# Altium schematic sheet Top_Sheet.SchDoc
size A4; DocumentNumber: 1; SheetNumber: 1; SheetTotal: 17
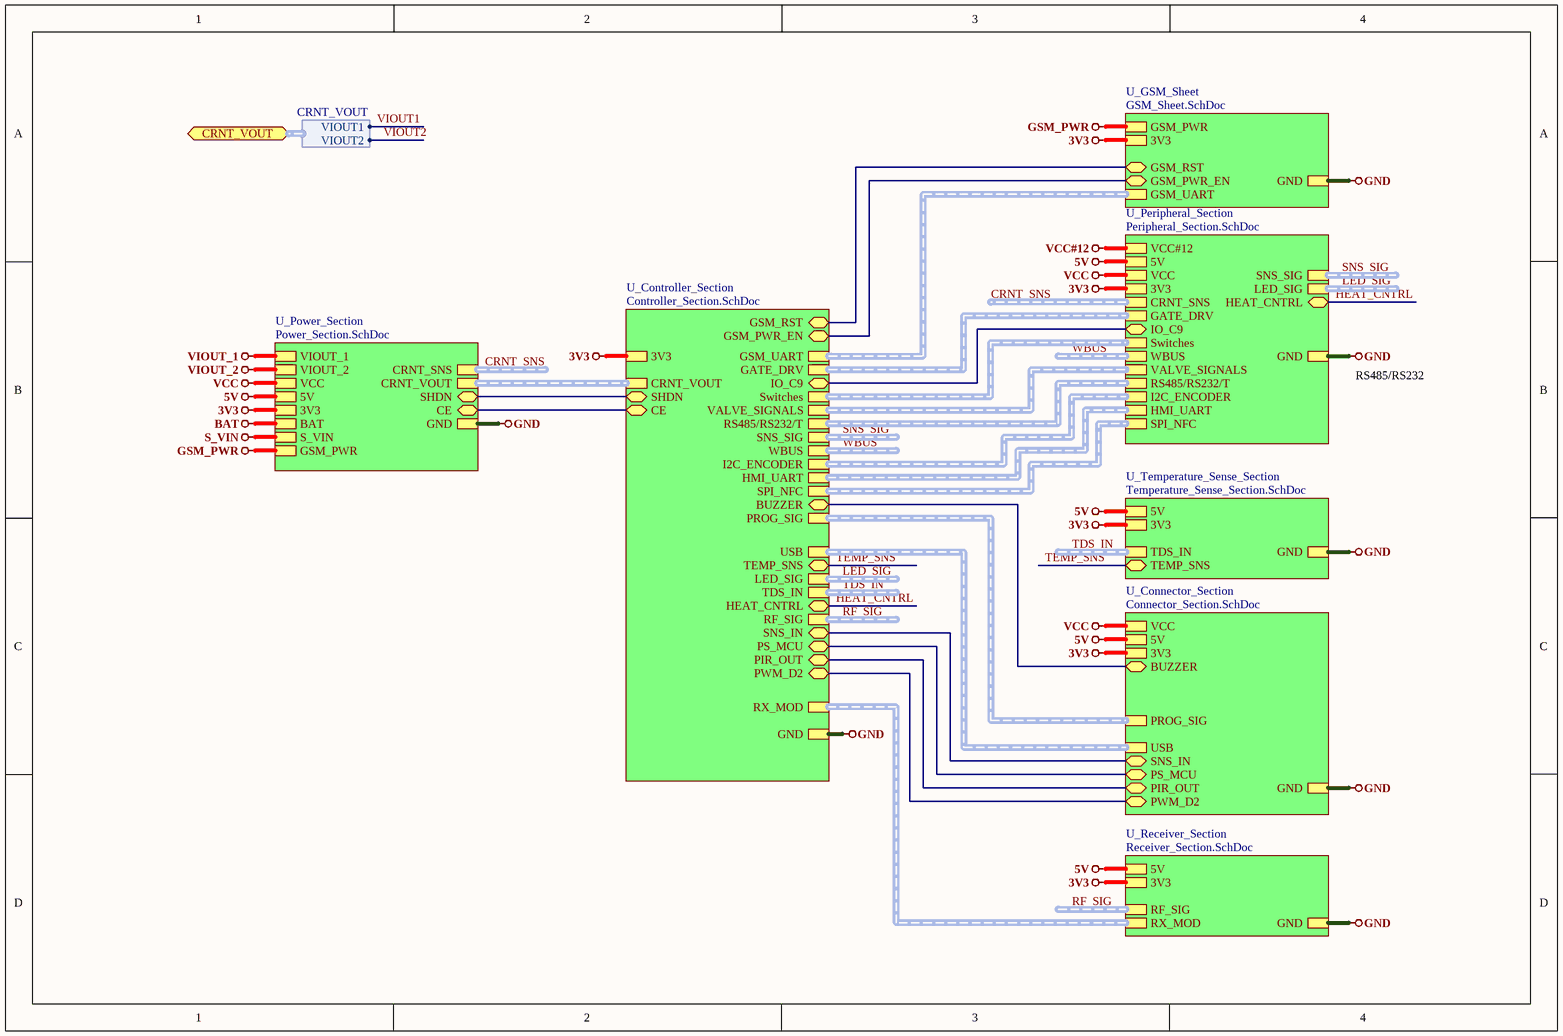
[diagram p0: Top_Sheet.SchDoc]

## Sub-sheets
U_Connector_Section = Connector_Section.SchDoc: PROG_SIG (harness PROG_SIG), BUZZER (bidir), VCC, 5V, 3V3, GND, PS_MCU (bidir), SNS_IN (bidir), PIR_OUT (bidir), USB (harness USB), PWM_D2 (bidir)
U_Controller_Section = Controller_Section.SchDoc: PROG_SIG (harness PROG_SIG), BUZZER (bidir), GATE_DRV (harness GATE_DRV), IO_C9 (bidir), GND, 3V3, SHDN (bidir), Switches (harness Switches), LED_SIG (harness LED_SIG), HEAT_CNTRL (bidir), VALVE_SIGNALS (harness VALVE_SIGNALS), SNS_SIG (harness SNS_SIG), WBUS (harness WBUS), PS_MCU (bidir), SNS_IN (bidir), RF_SIG (harness RF_SIG), PIR_OUT (bidir), RX_MOD (harness RX_MOD), CRNT_VOUT (harness CRNT_VOUT), TDS_IN (harness TDS_IN), USB (harness USB), PWM_D2 (bidir), CE (bidir), I2C_ENCODER (harness VALVE_SIGNALS), HMI_UART (harness VALVE_SIGNALS), GSM_UART (harness GSM_UART), GSM_PWR_EN (bidir), GSM_RST (bidir), TEMP_SNS (bidir), SPI_NFC (harness VALVE_SIGNALS), RS485/RS232/T (harness RS485/RS232/T)
U_GSM_Sheet = GSM_Sheet.SchDoc: GSM_UART (harness GSM_UART), GND, GSM_PWR, 3V3, GSM_RST (bidir), GSM_PWR_EN (bidir)
U_Peripheral_Section = Peripheral_Section.SchDoc: VCC, GND, 3V3, GATE_DRV (harness GATE_DRV), IO_C9 (bidir), Switches (harness Switches), CRNT_SNS (harness CRNT_SNS), VALVE_SIGNALS (harness VALVE_SIGNALS), SNS_SIG (harness SNS_SIG), LED_SIG (harness LED_SIG), 5V, HEAT_CNTRL (bidir), WBUS (harness WBUS), I2C_ENCODER (harness VALVE_SIGNALS), HMI_UART (harness VALVE_SIGNALS), VCC#12, SPI_NFC (harness VALVE_SIGNALS), RS485/RS232/T (harness RS485/RS232/T)
U_Power_Section = Power_Section.SchDoc: VIOUT_1, VIOUT_2, VCC, 5V, 3V3, GND, CRNT_SNS (harness CRNT_SNS), SHDN (bidir), CRNT_VOUT (harness CRNT_VOUT), BAT, S_VIN, CE (bidir), GSM_PWR
U_Receiver_Section = Receiver_Section.SchDoc: RF_SIG (harness RF_SIG), 5V, GND, RX_MOD (harness RX_MOD), 3V3
U_Temperature_Sense_Section = Temperature_Sense_Section.SchDoc: 5V, GND, 3V3, TDS_IN (harness TDS_IN), TEMP_SNS (bidir)

## Ports
CRNT_VOUT (bidir, harness CRNT_VOUT)

## Harnesses
CRNT_VOUT: VIOUT1, VIOUT2

## Nets
3V3: sheet U_Power_Section/3V3, sheet U_Connector_Section/3V3, sheet U_Temperature_Sense_Section/3V3, sheet U_Receiver_Section/3V3, sheet U_Controller_Section/3V3, sheet U_Peripheral_Section/3V3, sheet U_GSM_Sheet/3V3
5V: sheet U_Power_Section/5V, sheet U_Connector_Section/5V, sheet U_Temperature_Sense_Section/5V, sheet U_Receiver_Section/5V, sheet U_Peripheral_Section/5V
BAT: sheet U_Power_Section/BAT
GND: sheet U_Power_Section/GND, sheet U_Connector_Section/GND, sheet U_Temperature_Sense_Section/GND, sheet U_Receiver_Section/GND, sheet U_Controller_Section/GND, sheet U_Peripheral_Section/GND, sheet U_GSM_Sheet/GND
GSM_PWR: sheet U_Power_Section/GSM_PWR, sheet U_GSM_Sheet/GSM_PWR
S_VIN: sheet U_Power_Section/S_VIN
VCC: sheet U_Power_Section/VCC, sheet U_Connector_Section/VCC, sheet U_Peripheral_Section/VCC
VCC#12: sheet U_Peripheral_Section/VCC#12
VIOUT_1: sheet U_Power_Section/VIOUT_1
VIOUT_2: sheet U_Power_Section/VIOUT_2
HEAT_CNTRL: sheet U_Controller_Section/HEAT_CNTRL, sheet U_Peripheral_Section/HEAT_CNTRL
TEMP_SNS: sheet U_Temperature_Sense_Section/TEMP_SNS, sheet U_Controller_Section/TEMP_SNS
VIOUT1: port CRNT_VOUT.VIOUT1
VIOUT2: port CRNT_VOUT.VIOUT2
(unnamed): sheet U_Power_Section/SHDN, sheet U_Controller_Section/SHDN
(unnamed): sheet U_Power_Section/CE, sheet U_Controller_Section/CE
(unnamed): sheet U_Connector_Section/BUZZER, sheet U_Controller_Section/BUZZER
(unnamed): sheet U_Connector_Section/PS_MCU, sheet U_Controller_Section/PS_MCU
(unnamed): sheet U_Connector_Section/SNS_IN, sheet U_Controller_Section/SNS_IN
(unnamed): sheet U_Connector_Section/PIR_OUT, sheet U_Controller_Section/PIR_OUT
(unnamed): sheet U_Connector_Section/PWM_D2, sheet U_Controller_Section/PWM_D2
(unnamed): sheet U_Controller_Section/IO_C9, sheet U_Peripheral_Section/IO_C9
(unnamed): sheet U_Controller_Section/GSM_PWR_EN, sheet U_GSM_Sheet/GSM_PWR_EN
(unnamed): sheet U_Controller_Section/GSM_RST, sheet U_GSM_Sheet/GSM_RST

## Buses and harness runs
harness CRNT_SNS = sheet U_Peripheral_Section/CRNT_SNS
harness CRNT_SNS = sheet U_Power_Section/CRNT_SNS
harness LED_SIG = sheet U_Controller_Section/LED_SIG
harness LED_SIG = sheet U_Peripheral_Section/LED_SIG
harness RF_SIG = sheet U_Controller_Section/RF_SIG
harness RF_SIG = sheet U_Receiver_Section/RF_SIG
harness sheet U_Connector_Section/PROG_SIG = sheet U_Controller_Section/PROG_SIG
harness sheet U_Connector_Section/USB = sheet U_Controller_Section/USB
harness sheet U_Controller_Section/CRNT_VOUT = sheet U_Power_Section/CRNT_VOUT
harness sheet U_Controller_Section/GATE_DRV = sheet U_Peripheral_Section/GATE_DRV
harness sheet U_Controller_Section/GSM_UART = sheet U_GSM_Sheet/GSM_UART
harness sheet U_Controller_Section/HMI_UART = sheet U_Peripheral_Section/HMI_UART
harness sheet U_Controller_Section/I2C_ENCODER = sheet U_Peripheral_Section/I2C_ENCODER
harness sheet U_Controller_Section/RS485/RS232/T = sheet U_Peripheral_Section/RS485/RS232/T
harness sheet U_Controller_Section/RX_MOD = sheet U_Receiver_Section/RX_MOD
harness sheet U_Controller_Section/SPI_NFC = sheet U_Peripheral_Section/SPI_NFC
harness sheet U_Controller_Section/Switches = sheet U_Peripheral_Section/Switches
harness sheet U_Controller_Section/VALVE_SIGNALS = sheet U_Peripheral_Section/VALVE_SIGNALS
harness SNS_SIG = sheet U_Controller_Section/SNS_SIG
harness SNS_SIG = sheet U_Peripheral_Section/SNS_SIG
harness TDS_IN = sheet U_Controller_Section/TDS_IN
harness TDS_IN = sheet U_Temperature_Sense_Section/TDS_IN
harness WBUS = sheet U_Controller_Section/WBUS
harness WBUS = sheet U_Peripheral_Section/WBUS

## Notes on the sheet
- RS485/RS232